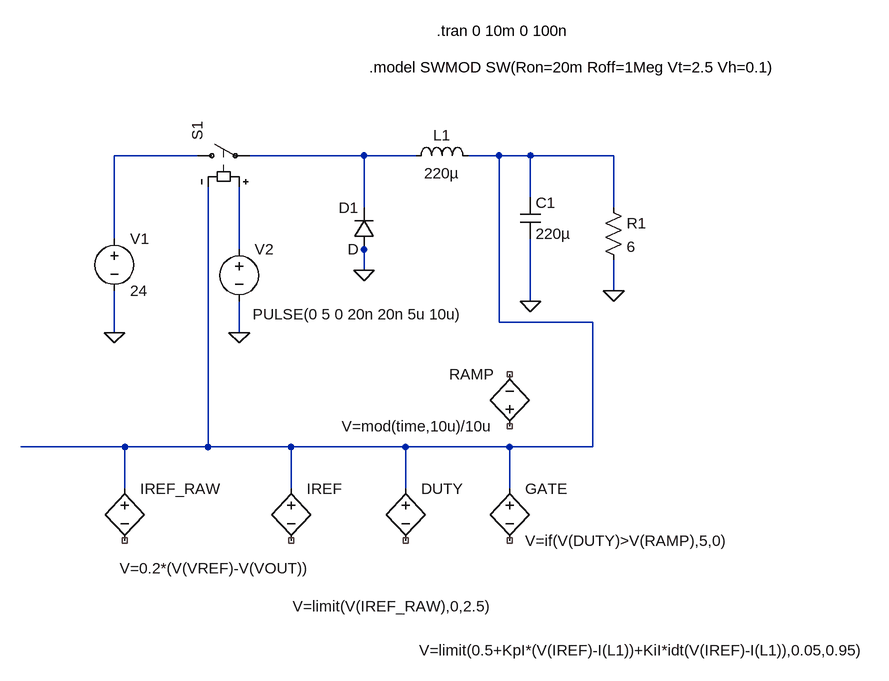
[diagram p0: schematic Closed Loop.asc]
Closed Loop.asc, the LTspice schematic file:
Version 4.1
SHEET 1 1188 780
WIRE 48 0 -80 0
WIRE 304 0 128 0
WIRE 384 0 304 0
WIRE 512 0 464 0
WIRE 560 0 512 0
WIRE 688 0 560 0
WIRE 560 64 560 0
WIRE 304 80 304 0
WIRE 688 80 688 0
WIRE -80 128 -80 0
WIRE 112 144 112 48
WIRE 304 144 304 128
WIRE 304 176 304 144
WIRE 688 208 688 160
WIRE 560 224 560 128
WIRE 512 256 512 0
WIRE 656 256 512 256
WIRE -80 272 -80 208
WIRE 112 272 112 224
WIRE -64 448 -224 448
WIRE 64 448 64 48
WIRE 64 448 -64 448
WIRE 192 448 64 448
WIRE 368 448 192 448
WIRE 528 448 368 448
WIRE 656 448 656 256
WIRE 656 448 528 448
WIRE -64 512 -64 448
WIRE 192 512 192 448
WIRE 368 512 368 448
WIRE 528 512 528 448
FLAG -80 272 0
FLAG 560 224 0
FLAG 112 272 0
FLAG 688 208 0
FLAG 304 176 0
SYMBOL voltage -80 112 R0
WINDOW 123 0 0 Left 0
WINDOW 39 0 0 Left 0
SYMATTR InstName V1
SYMATTR Value 24
SYMBOL cap 544 64 R0
SYMATTR InstName C1
SYMATTR Value 220µ
SYMBOL ind 368 16 R270
WINDOW 0 32 56 VTop 2
WINDOW 3 5 56 VBottom 2
SYMATTR InstName L1
SYMATTR Value 220µ
SYMATTR SpiceLine Rser=1m
SYMBOL diode 320 144 R180
WINDOW 0 24 64 Left 2
WINDOW 3 24 0 Left 2
SYMATTR InstName D1
SYMBOL sw 32 0 R270
WINDOW 3 24 96 Invisible 2
SYMATTR InstName S1
SYMATTR Value SWMOD
SYMBOL voltage 112 128 R0
WINDOW 3 21 116 Left 2
WINDOW 123 0 0 Left 0
WINDOW 39 0 0 Left 0
SYMATTR InstName V2
SYMATTR Value PULSE(0 5 0 20n 20n 5u 10u)
SYMBOL res 672 64 R0
SYMATTR InstName R1
SYMATTR Value 6
SYMBOL bv 528 432 R180
WINDOW 0 24 96 Left 2
WINDOW 3 24 16 Left 2
SYMATTR InstName RAMP
SYMATTR Value V=mod(time,10u)/10u
SYMBOL bv 192 496 R0
WINDOW 3 2 197 Left 2
SYMATTR InstName IREF
SYMATTR Value V=limit(V(IREF_RAW),0,2.5)
SYMBOL bv 368 496 R0
WINDOW 3 21 265 Left 2
SYMATTR InstName DUTY
SYMATTR Value V=limit(0.5+KpI*(V(IREF)-I(L1))+KiI*idt(V(IREF)-I(L1)),0.05,0.95)
SYMBOL bv 528 496 R0
SYMATTR InstName GATE
SYMATTR Value V=if(V(DUTY)>V(RAMP),5,0)
SYMBOL bv -64 496 R0
WINDOW 3 -8 139 Left 2
SYMATTR InstName IREF_RAW
SYMATTR Value V=0.2*(V(VREF)-V(VOUT))
+100*idt(V(VREF)-V(VOUT))
TEXT 416 -192 Left 2 !.tran 0 10m 0 100n
TEXT 312 -136 Left 2 !.model SWMOD SW(Ron=20m Roff=1Meg Vt=2.5 Vh=0.1)

The netlist it stands for:
* Closed Loop.asc
V1 N001 0 24
C1 N003 0 220µ
L1 N002 N003 220µ Rser=1m
D1 0 N002 D
S1 N001 N002 N004 N003 SWMOD
V2 N004 0 PULSE(0 5 0 20n 20n 5u 10u)
R1 N003 0 6
B§RAMP NC_01 NC_02 V=mod(time,10u)/10u
B§IREF N003 NC_03 V=limit(V(IREF_RAW),0,2.5)
B§DUTY N003 NC_04 V=limit(0.5+KpI*(V(IREF)-I(L1))+KiI*idt(V(IREF)-I(L1)),0.05,0.95)
B§GATE N003 NC_05 V=if(V(DUTY)>V(RAMP),5,0)
B§IREF_RAW N003 NC_06 V=0.2*(V(VREF)-V(VOUT))
.model D D
.lib standard.dio
.tran 0 10m 0 100n
.model SWMOD SW(Ron=20m Roff=1Meg Vt=2.5 Vh=0.1)
.backanno
.end